# Altium schematic sheet 28_Radar_PMIC_and_rail_filters.SchDoc
size 289 x 396 mm
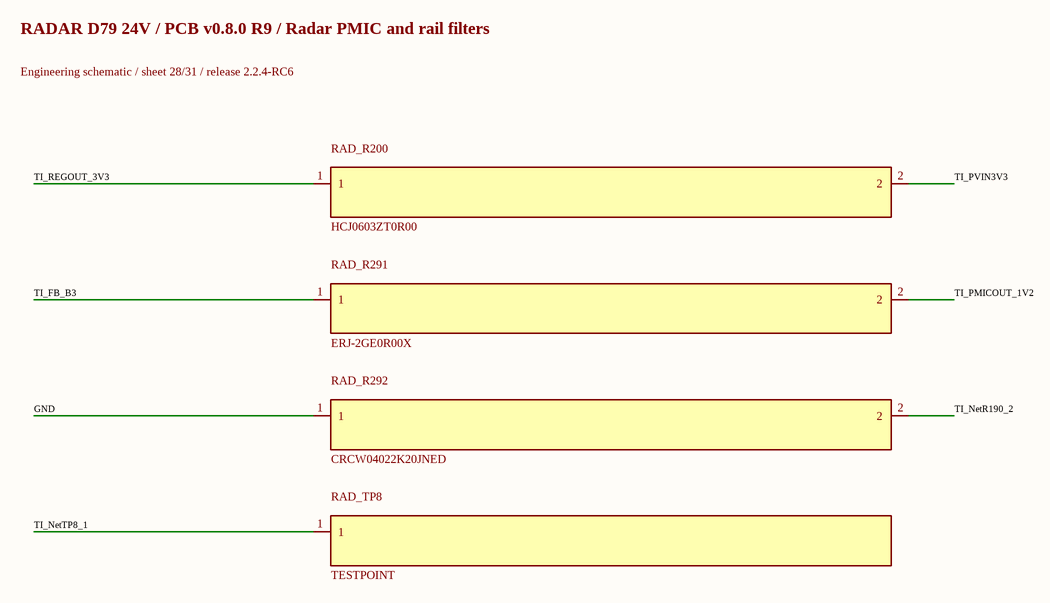
[diagram p0: 28_Radar_PMIC_and_rail_filters.SchDoc]

## Parts
RAD_R200  HCJ0603ZT0R00  [FP-HCJ0603ZT0R00_0603-MFG]
RAD_R291  ERJ-2GE0R00X  [0402L]
RAD_R292  CRCW04022K20JNED  [0402L]
RAD_TP8  TESTPOINT  [TP_25MIL-SMT]

## Nets
GND: RAD_R292.1
TI_FB_B3: RAD_R291.1
TI_NetR190_2: RAD_R292.2
TI_NetTP8_1: RAD_TP8.1
TI_PMICOUT_1V2: RAD_R291.2
TI_PVIN3V3: RAD_R200.2
TI_REGOUT_3V3: RAD_R200.1

## Notes on the sheet
- RADAR D79 24V / PCB v0.8.0 R9 / Radar PMIC and rail filters
- Engineering schematic / sheet 28/31 / release 2.2.4-RC6